# Altium schematic sheet Core.SchDoc
size A4; SheetNumber: 2; SheetTotal: 3
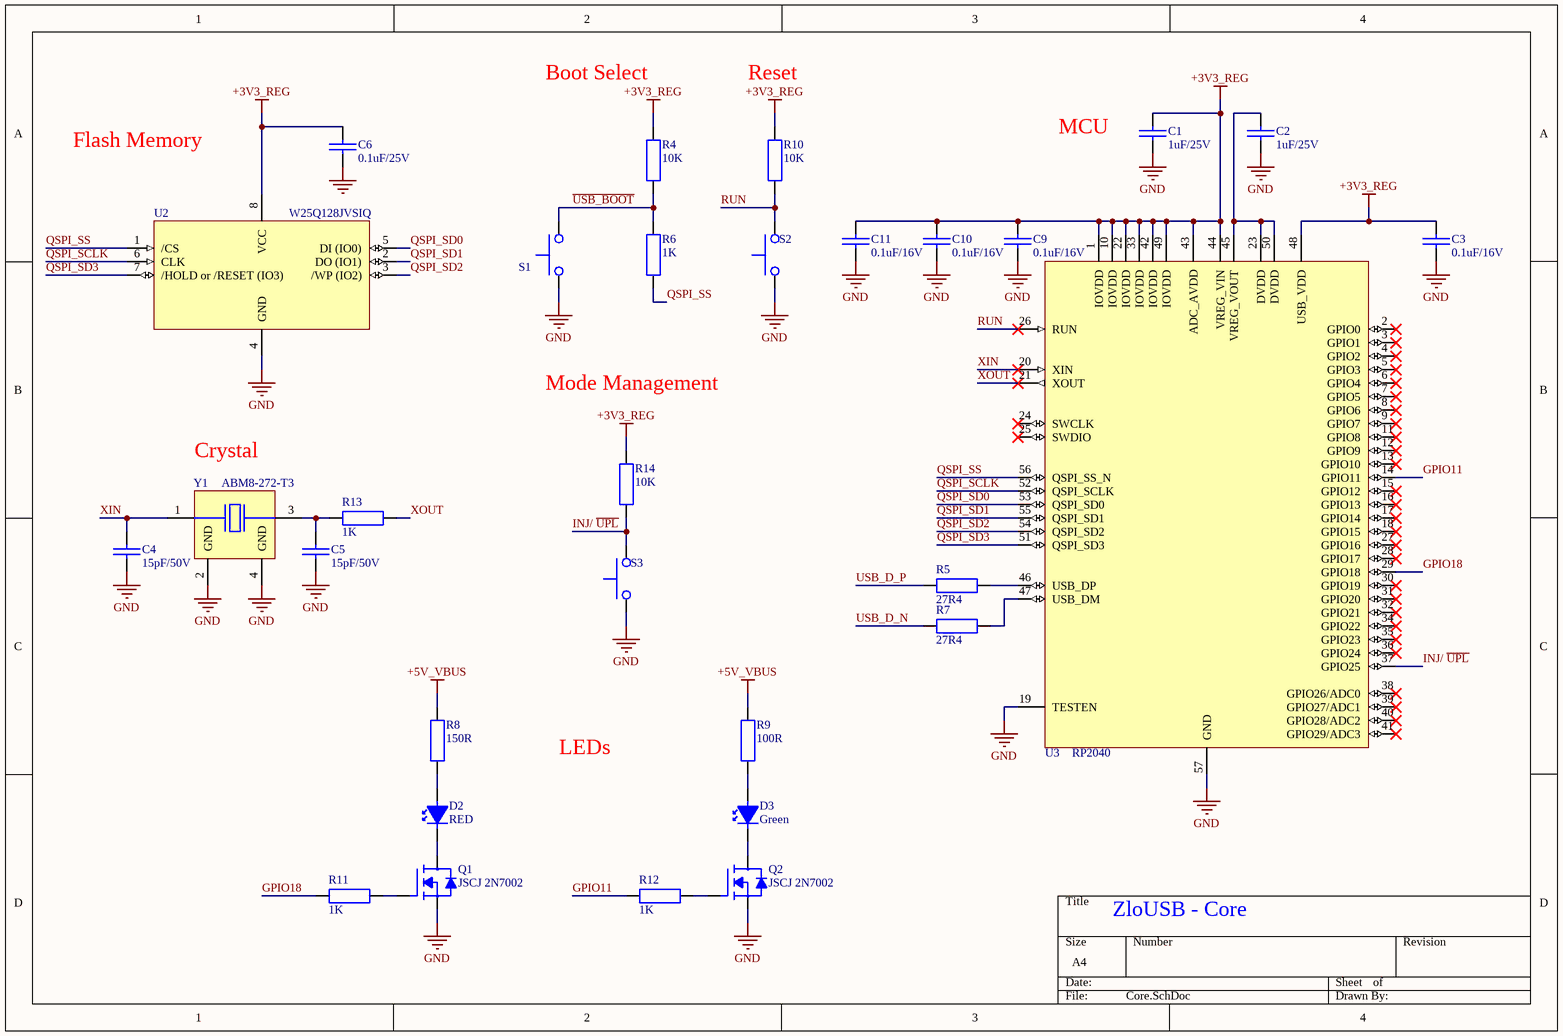
[diagram p0: Core.SchDoc]

## Parts
C1  1uF/25V  [CAPC1005X60N]
C2  1uF/25V  [CAPC1005X60N]
C3  0.1uF/16V  [CAPC1005X55N]
C4  15pF/50V  [CAPC1005X55N]
C5  15pF/50V  [CAPC1005X55N]
C6  0.1uF/25V  [CAPC2012X95N]
C9  0.1uF/16V  [CAPC1005X55N]
C10  0.1uF/16V  [CAPC1005X55N]
C11  0.1uF/16V  [CAPC1005X55N]
D2  RED  [DIOC1608X70N]
D3  Green  [DIOC2012X95N]
Q1  JSCJ 2N7002  [SOT95P240X115-3N]
Q2  JSCJ 2N7002  [SOT95P240X115-3N]
R4  10K  [RESC1005X40N]
R5  27R4  [RESC1005X40N]
R6  1K  [RESC1005X40N]
R7  27R4  [RESC1005X40N]
R8  150R  [RESC1608X55N]
R9  100R  [RESC1608X55N]
R10  10K  [RESC1005X40N]
R11  1K  [RESC1005X40N]
R12  1K  [RESC1005X40N]
R13  1K  [RESC1005X40N]
R14  10K  [RESC1005X40N]
S1  XUNPU TS-1088-AR02016  [XUNPU TS-1088-AR02016]  (value not drawn)
S2  XUNPU TS-1088-AR02016  [XUNPU TS-1088-AR02016]  (value not drawn)
S3  XUNPU TS-1088-AR02016  [XUNPU TS-1088-AR02016]  (value not drawn)
U2  W25Q128JVSIQ  [SOIC127P790X216-8N]
U3  RP2040  [QFN40P700X700X90-57N]
Y1  ABM8-272-T3  [ABRACON ABM8-272-T3]

## Nets
+3V3_REG: C1.1 C3.2 C6.2 C9.2 C10.2 C11.2 R4.2 R10.2 R14.2 U2.8(VCC) U3.1(IOVDD) U3.10(IOVDD) U3.22(IOVDD) U3.33(IOVDD) U3.42(IOVDD) U3.43(ADC_AVDD) U3.44(VREG_VIN) U3.48(USB_VDD) U3.49(IOVDD)
+5V_VBUS: R8.2 R9.2
GND: C1.2 C2.2 C3.1 C4.1 C5.1 C6.1 C9.1 C10.1 C11.1 Q1.2 Q2.2 S1.1 S2.1 S3.1 U2.4(GND) U3.19(TESTEN) U3.57(GND) Y1.2(GND) Y1.4(GND)
GPIO11: R12.1 U3.14(GPIO11)
GPIO18: R11.1 U3.29(GPIO18)
INJ/ ~{UPL}: R14.1 S3.2 U3.37(GPIO25)
QSPI_SCLK: U2.6(CLK) U3.52(QSPI_SCLK)
QSPI_SD0: U2.5(DI_(IO0)) U3.53(QSPI_SD0)
QSPI_SD1: U2.2(DO_(IO1)) U3.55(QSPI_SD1)
QSPI_SD2: U2.3(/WP_(IO2)) U3.54(QSPI_SD2)
QSPI_SD3: U2.7(/HOLD_or_/RESET_(IO3)) U3.51(QSPI_SD3)
QSPI_SS: R6.2 U2.1(/CS) U3.56(QSPI_SS_N)
RUN: R10.1 S2.2 U3.26(RUN)
~{USB_BOOT}: R4.1 R6.1 S1.2
USB_D_N: R7.1
USB_D_P: R5.1
XIN: C4.2 U3.20(XIN) Y1.1
XOUT: R13.2 U3.21(XOUT)
NetC2_1: C2.1 U3.23(DVDD) U3.45(VREG_VOUT) U3.50(DVDD)
NetC5_2: C5.2 R13.1 Y1.3
NetD2_1: D2.1 R8.1
NetD2_2: D2.2 Q1.3
NetD3_1: D3.1 R9.1
NetD3_2: D3.2 Q2.3
NetQ1_1: Q1.1 R11.2
NetQ2_1: Q2.1 R12.2
NetR5_2: R5.2 U3.46(USB_DP)
NetR7_2: R7.2 U3.47(USB_DM)

Not connected (* = marked no-connect by the designer): U3 2(GPIO0)* 3(GPIO1)* 4(GPIO2)* 5(GPIO3)* 6(GPIO4)* 7(GPIO5)* 8(GPIO6)* 9(GPIO7)* 11(GPIO8)* 12(GPIO9)* 13(GPIO10)* 15(GPIO12)* 16(GPIO13)* 17(GPIO14)* 18(GPIO15)* 24(SWCLK)* 25(SWDIO)* 27(GPIO16)* 28(GPIO17)* 30(GPIO19)* 31(GPIO20)* 32(GPIO21)* 34(GPIO22)* 35(GPIO23)* 36(GPIO24)* 38(GPIO26/ADC0)* 39(GPIO27/ADC1)* 40(GPIO28/ADC2)* 41(GPIO29/ADC3)*

## Notes on the sheet
- Boot Select
- Reset
- Flash Memory
- MCU
- Mode Management
- Crystal
- LEDs
- ZloUSB - Core

## Library data of the parts
C1 C2 = Samsung Electro-Mechanics CL05A105KA5NQNC: CAP CER 1UF 25V X5R 0402; Manufacturer Part Number: CL05A105KA5NQNC; ComponentLink1Description: Datasheet; ComponentLink1URL: https://mm.digikey.com/Volume0/opasdata/d220001/medias/docus/41/CL05A105KA5NQNC.pdf; Manufacturer: Samsung Electro-Mechanics; LCSC Part #: C52923; JLCPCB Parts Type: Basic; JLCPCB PCBA Type: Economic and Standard; Supplier 1: LCSC; Supplier Part Number 1: C52923
C3 C9-C11 = Samsung Electro-Mechanics CL05B104KO5NNNC: CAP CER 0.1UF 16V X7R 0402; Manufacturer Part Number: CL05B104KO5NNNC; ComponentLink1Description: Datasheet; ComponentLink1URL: https://mm.digikey.com/Volume0/opasdata/d220001/medias/docus/609/CL05B104KO5NNNC.pdf; Manufacturer: Samsung Electro-Mechanics; LCSC Part #: C1525; JLCPCB Parts Type: Basic; JLCPCB PCBA Type: Economic and Standard
C4 C5 = FH 0402CG150J500NT: CAP CER 15pF 50V C0G 0402; Manufacturer: FH; Manufacturer Part Number: 0402CG150J500NT; ComponentLink1Description: Datasheet; ComponentLink1URL: https://www.lcsc.com/datasheet/C1548.pdf?spm=wm.sxq.inf.ggs&lcsc_vid=FlIPVFxSEVAMBl1QQ1JdVl0EQlZYVFFSQVZZUFJeRVcxVlNeQ1ZcX1ZUQlReXjsOAxUeFF5JWBYZEEoKFBINSQcJGk4%3D; LCSC Part #: C1548; JLCPCB Parts Type: Basic; JLCPCB PCBA Type: Economic and Standard
C6 = Yageo CC0805KRX7R8BB104: CAP CER 0.1UF 25V X7R 0805; Manufacturer: Yageo; Manufacturer Part Number: CC0805KRX7R8BB104; ComponentLink1Description: Datasheet; ComponentLink1URL: https://yageogroup.com/content/datasheet/asset/file/UPY-GPHC_X7R_6_3V-TO-250V; LCSC Part #: C519981; Supplier 1: LCSC; Supplier Part Number 1: C519981; JLCPCB Parts Type: Extended; JLCPCB PCBA Type: Economic and Standard
D2 = Hubei KENTO Elec KT-0603R: LED RED WATER CLEAR 0603 SMD; Manufacturer Part Number: KT-0603R; ComponentLink1Description: Datasheet; ComponentLink1URL: https://www.lcsc.com/datasheet/C2286.pdf?spm=wm.sxq.inf.ggs&lcsc_vid=EgULX1wEEgNWVVAHFFheXgEEQVBbUFYFRwIPBF1XRgMxVlNeQ1RbXlJRQFJaUzsOAxUeFF5JWBYZEEoKFBINSQcJGk4%3D; Manufacturer: Hubei KENTO Elec; ComponentLink2Description: 3D Model Source; ComponentLink2URL: *; JLCPCB Parts Type: Basic; JLCPCB PCBA Type: Economic and Standard; LCSC Part #: C2286
D3 = Hubei KENTO Elec KT-0805G: LED EMERALD GREEN 0805 SMD; Manufacturer Part Number: KT-0805Y; ComponentLink1Description: Datasheet; ComponentLink1URL: https://www.lcsc.com/datasheet/C2297.pdf?spm=wm.sxq.inf.ggs&lcsc_vid=EgULX1wEEgNWVVAHFFheXgEEQVBbUFYFRwIPBF1XRgMxVlNeQ1RYVlRQT1VeUDsOAxUeFF5JWBYZEEoKFBINSQcJGk4%3D; Manufacturer: Hubei KENTO Elec; ComponentLink2Description: 3D Model Source; ComponentLink2URL: *; JLCPCB Parts Type: Basic; JLCPCB PCBA Type: Economic and Standard; LCSC Part #: C2297
Q1 Q2 = JSCJ 2N7002: MOSFET N-CH 60V 115mA SOT-23; Manufacturer Part Number: 2N7002; ComponentLink1Description: Datasheet; ComponentLink1URL: https://www.lcsc.com/datasheet/C8545.pdf?spm=wm.sxq.inf.ggs&lcsc_vid=EgULX1wEEgNWVVAHFFheXgEEQVBbUFYFRwIPBF1XRgMxVlNeQ1RYUlNfQFBWVTsOAxUeFF5JWBYZEEoKFBINSQcJGk4%3D; Manufacturer: JSCJ; JLCPCB Parts Type: Basic; JLCPCB PCBA Type: Economic and Standard; ComponentLink3Description: 3D Model Source; ComponentLink3URL: *; LCSC Part #: C8545
R4 R10 R14 = UNI-ROYAL 0402WGF1002TCE: RES 10kΩ ±1% 62.5mW 0402; Manufacturer Part Number: 0402WGF1002TCE; ComponentLink1Description: Datasheet; ComponentLink1URL: https://www.lcsc.com/datasheet/C25905.pdf?spm=wm.sxq.inf.ggs&lcsc_vid=QwRWVlFeFgUPVwAHRlQMVFRWElEIXlYDQFlcUQdRRFYxVlNeRVdaVFZVRFRdXzsOAxUeFF5JWBYZEEoKFBINSQcJGk4%3D; Manufacturer: UNI-ROYAL; ComponentLink2Description: 3D Model Source; ComponentLink2URL: *; JLCPCB Parts Type: Basic; JLCPCB PCBA Type: Economic and Standard; LCSC Part #: C25744
R5 R7 = UNI-ROYAL 0402WGF274JTCE: RES 27.4Ω ±1% 62.5mW 0402; Manufacturer Part Number: 0402WGF274JTCE; ComponentLink1Description: Datasheet; ComponentLink1URL: https://www.lcsc.com/datasheet/C31439.pdf?spm=wm.sxq.inf.ggs&lcsc_vid=RVMLXldXRwcKUgUEEVhaBQcAQ1deVlcCFVAKV1VTRVcxVlNeRVdaX1xXQ1laUDsOAxUeFF5JWBYZEEoKFBINSQcJGk4%3D; Manufacturer: UNI-ROYAL; ComponentLink2Description: 3D Model Source; ComponentLink2URL: *; Supplier 1: LCSC; Supplier Part Number 1: C31439; JLCPCB Parts Type: Extended; JLCPCB PCBA Type: Economic and Standard; LCSC Part #: C31439
R6 R11-R13 = UNI-ROYAL 0402WGF1001TCE: RES 1kΩ ±1% 62.5mW 0402; Manufacturer Part Number: 0402WGF1001TCE; ComponentLink1Description: Datasheet; ComponentLink1URL: https://www.lcsc.com/datasheet/C25905.pdf?spm=wm.sxq.inf.ggs&lcsc_vid=QwRWVlFeFgUPVwAHRlQMVFRWElEIXlYDQFlcUQdRRFYxVlNeRVdaVFZVRFRdXzsOAxUeFF5JWBYZEEoKFBINSQcJGk4%3D; Manufacturer: UNI-ROYAL; ComponentLink2Description: 3D Model Source; ComponentLink2URL: *; JLCPCB Parts Type: Basic; JLCPCB PCBA Type: Economic and Standard; LCSC Part #: C11702
R8 = UNI-ROYAL 0603WAF1500T5E: RES 150Ω ±1% 100mW 0603; Manufacturer Part Number: 0603WAF1500T5E; ComponentLink1Description: Datasheet; ComponentLink1URL: https://www.lcsc.com/datasheet/C22808.pdf?spm=wm.sxq.inf.ggs&lcsc_vid=EgULX1wEEgNWVVAHFFheXgEEQVBbUFYFRwIPBF1XRgMxVlNeQ1RYUVJQQFdbXzsOAxUeFF5JWBYZEEoKFBINSQcJGk4%3D; Manufacturer: UNI-ROYAL; ComponentLink2Description: 3D Model Source; ComponentLink2URL: *; JLCPCB Parts Type: Basic; JLCPCB PCBA Type: Economic and Standard; LCSC Part #: C22808
R9 = UNI-ROYAL 0603WAF1000T5E: RES 100Ω ±1% 100mW 0603; Manufacturer Part Number: 0603WAF1000T5E; ComponentLink1Description: Datasheet; ComponentLink1URL: https://www.lcsc.com/datasheet/C22775.pdf?spm=wm.sxq.inf.ggs&lcsc_vid=EgULX1wEEgNWVVAHFFheXgEEQVBbUFYFRwIPBF1XRgMxVlNeQ1RYUFVUR1VcXjsOAxUeFF5JWBYZEEoKFBINSQcJGk4eFQsCAgIaSgADAwAHC0slRVNWV1xIHxUDCw%3D%3D; Manufacturer: 0603WAF1000T5E; ComponentLink2Description: 3D Model Source; ComponentLink2URL: *; JLCPCB Parts Type: Basic; JLCPCB PCBA Type: Economic and Standard; LCSC Part #: C22775
S1-S3 = XUNPU TS-1088-AR02016: SWITCH TACTILE SPST 160gf SMD; Manufacturer Part Number: TS-1088-AR02016; ComponentLink1Description: Datasheet; ComponentLink1URL: https://www.lcsc.com/datasheet/C720477.pdf?spm=wm.sxq.inf.ggs&lcsc_vid=QlFWU1RUTlJcVlxXFVVfUV1WQlNXBFRVFQQIX1EFTwMxVlNeRVldVFxXRVlXUTsOAxUeFF5JWBYZEEoKFBINSQcJGk4%3D; Manufacturer: XUNPU; ComponentLink2Description: 3D Model Source; ComponentLink2URL: *; Supplier 1: LCSC; Supplier Part Number 1: C720477; JLCPCB Parts Type: Basic; JLCPCB PCBA Type: Economic and Standard; LCSC Part #: C720477
U2 = Winbond W25Q128JVSIQ: FLASH - NOR Memory IC 128Mbit SPI - Quad I/O, QPI 133 MHz 8-SOIC; Manufacturer: Winbond Electronics; Manufacturer Part Number: W25Q128JVSIQ; ComponentLink1Description: Datasheet; ComponentLink1URL: https://mm.digikey.com/Volume0/opasdata/d220001/medias/docus/7161/256_W25Q128JV.pdf; ComponentLink2Description: 3D Model Source; ComponentLink2URL: *; Supplier 1: LCSC; Supplier Part Number 1: C97521; JLCPCB Parts Type: Basic; JLCPCB PCBA Type: Economic and Standard; LCSC Part #: C97521
U3 = Raspberry Pi RP2040: ARM® Cortex®-M0+ - Microcontroller IC 32-Bit Dual-Core 133MHz External Program Memory 56-QFN (7x7); Manufacturer Part Number: SC0914(13); ComponentLink1Description: Datasheet; ComponentLink1URL: https://pip-assets.raspberrypi.com/categories/814-rp2040/documents/RP-008371-DS-1-rp2040-datasheet.pdf; Manufacturer: Raspberry Pi; ComponentLink2Description: 3D Model Source; ComponentLink2URL: *; Supplier 1: LCSC; Supplier Part Number 1: C2040; JLCPCB Parts Type: Extended; JLCPCB PCBA Type: Economic and Standard; LCSC Part #: C2040
Y1 = ABRACON ABM8-272-T3: 12 MHz ±30ppm Crystal 10pF 50 Ohms 4-SMD, No Lead; Manufacturer Part Number: ABM8-272-T3; ComponentLink1Description: Datasheet; ComponentLink1URL: https://abracon.com/datasheets/ABM8-272-T3.pdf; Manufacturer: ABRACON; ComponentLink2Description: 3D Model Source; ComponentLink2URL: *; JLCPCB Parts Type: Extended; JLCPCB PCBA Type: Economic and Standard; Supplier 1: LCSC; Supplier Part Number 1: C20625731; LCSC Part #: C20625731